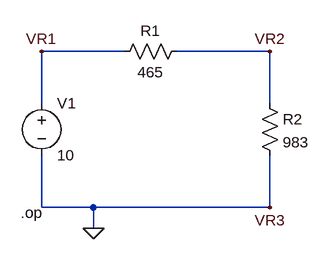
[diagram p0: schematic kvl.asc]
kvl.asc, the LTspice schematic file:
Version 4.1
SHEET 1 880 680
WIRE 160 32 32 32
WIRE 384 32 240 32
WIRE 32 112 32 32
WIRE 384 112 384 32
WIRE 32 272 32 192
WIRE 112 272 32 272
WIRE 384 272 384 192
WIRE 384 272 112 272
WIRE 112 304 112 272
FLAG 112 304 0
FLAG 384 32 VR2
FLAG 32 32 VR1
FLAG 384 272 VR3
SYMBOL voltage 32 96 R0
WINDOW 123 0 0 Left 0
WINDOW 39 0 0 Left 0
SYMATTR InstName V1
SYMATTR Value 10
SYMBOL res 144 48 R270
WINDOW 0 32 56 VTop 2
WINDOW 3 0 56 VBottom 2
SYMATTR InstName R1
SYMATTR Value 465
SYMBOL res 368 96 R0
SYMATTR InstName R2
SYMATTR Value 983
TEXT 0 280 Left 2 !.op

The netlist it stands for:
* kvl.asc
V1 VR1 0 10
R1 VR1 VR2 465
R2 VR2 0 983
.op
.backanno
.end